# Altium schematic sheet Sheet1.SchDoc
size B; DrawnBy: DMK; DocumentNumber: 3; Revision: A; SheetNumber: 1; SheetTotal: 3
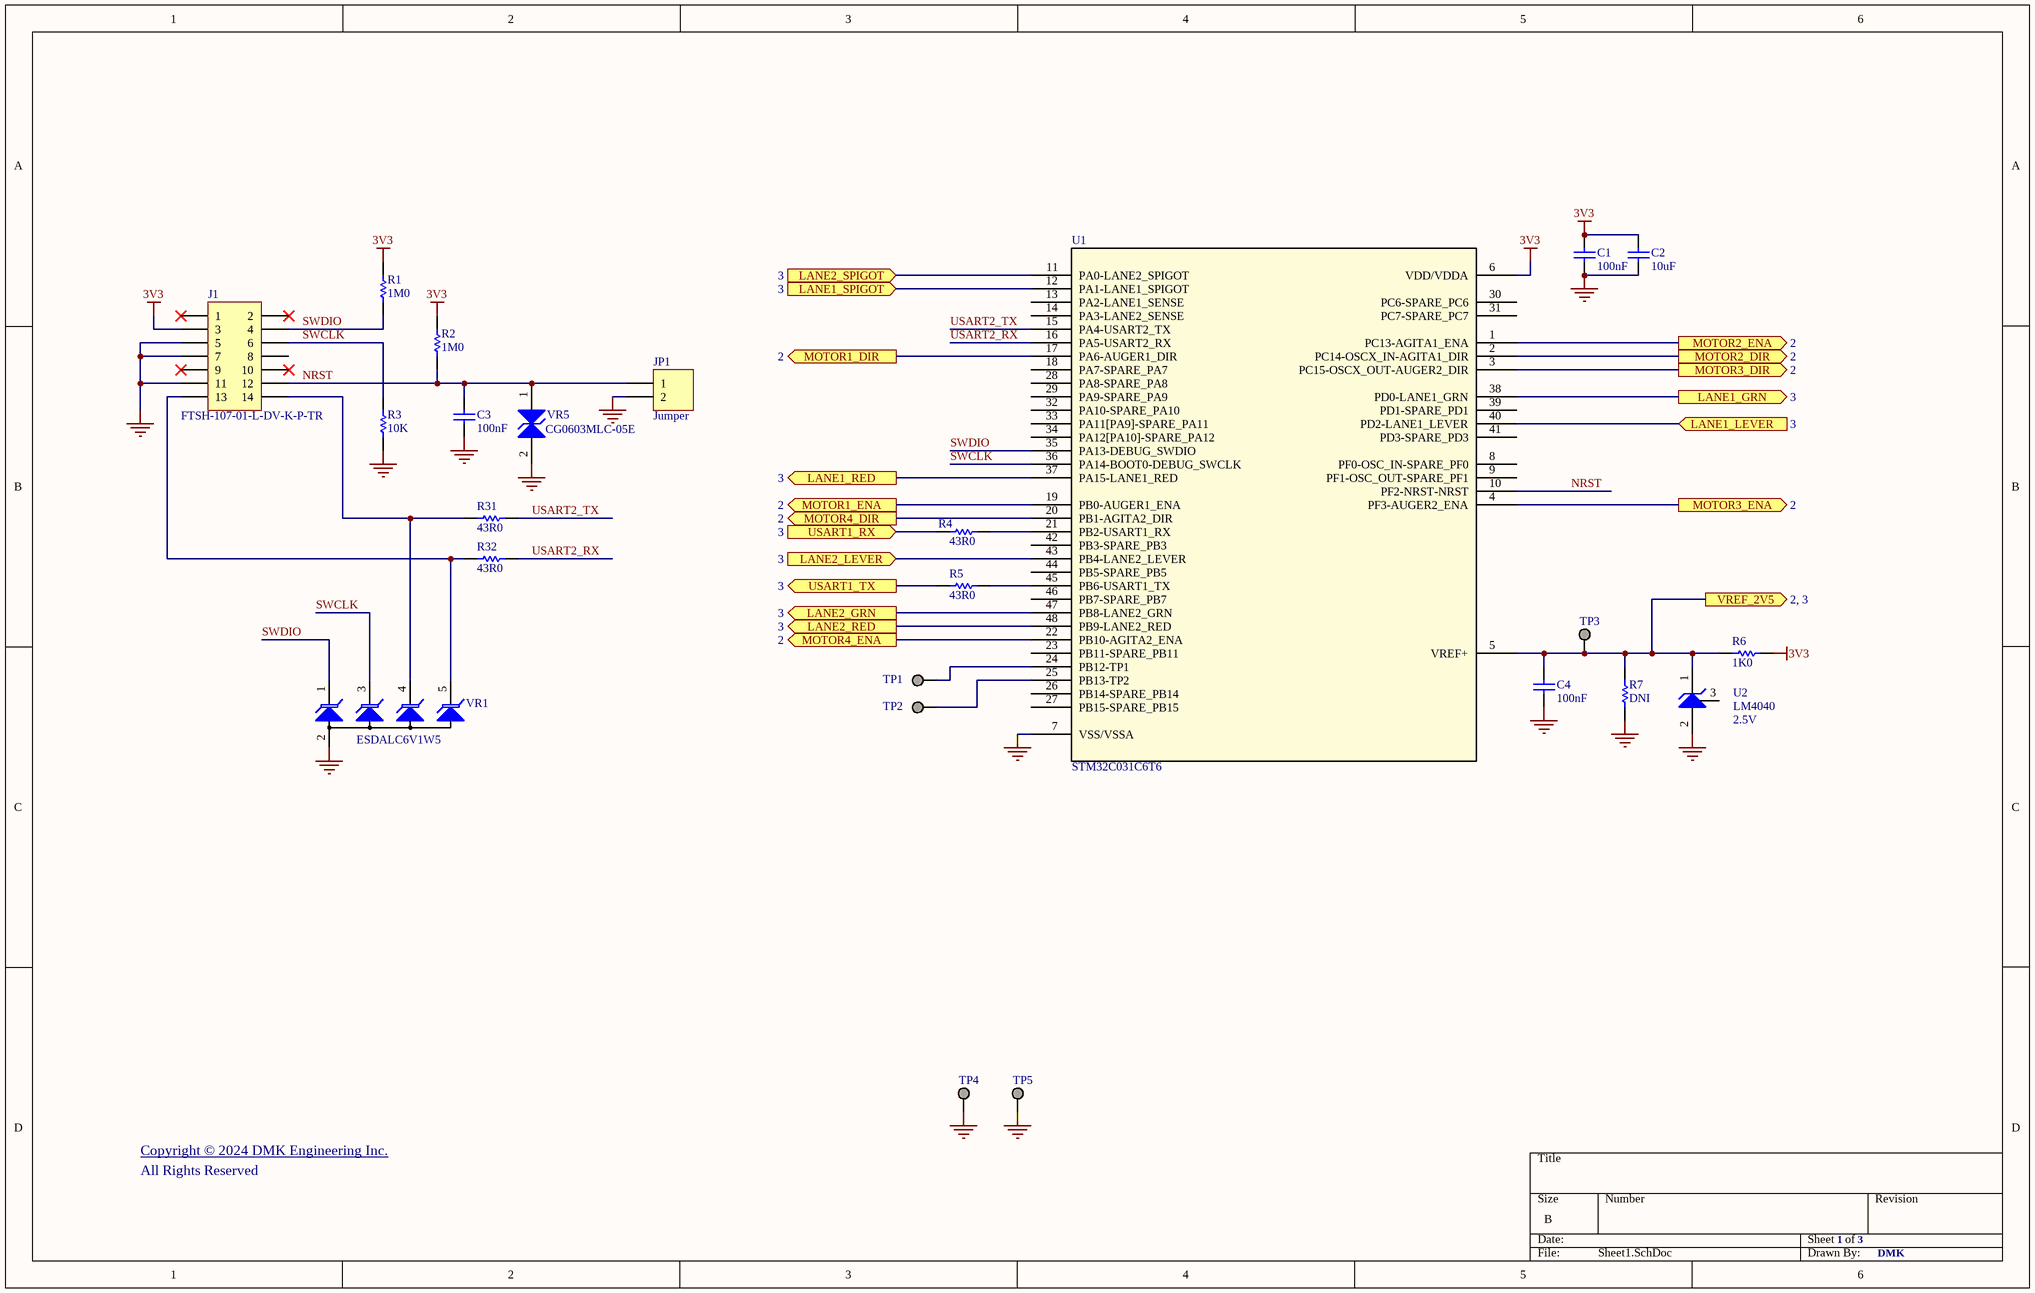
[diagram p0: Sheet1.SchDoc]

## Parts
C1  100nF  [C_0603]
C2  10uF  [C_0805]
C3  100nF  [C_0603]
C4  100nF  [C_0603]
J1  Manufacturer Part Number: FTSH-107-01-L-DV-K-P-TR  [SAMTEC_FTSH-107-01-L-DV-K-P-TR]  (hidden comment: Header 7X2)
JP1  Jumper  [HDR1X2]
R1  1M0  [R_0603]
R2  1M0  [R_0603]
R3  10K  [R_0603]
R4  43R0  [R_0603]
R5  43R0  [R_0603]
R6  1K0  [R_0603]
R7  DNI  [R_0603 - DNI]
R31  43R0  [R_0603]
R32  43R0  [R_0603]
TP1  TEST POINT  [TP]  (value not drawn)  (no BOM)
TP2  TEST POINT  [TP]  (value not drawn)  (no BOM)
TP3  TEST POINT  [TP]  (value not drawn)  (no BOM)
TP4  TEST POINT  [TP]  (value not drawn)  (no BOM)
TP5  TEST POINT  [TP]  (value not drawn)  (no BOM)
U1  STM32C031C6T6  [LQFP48-7x7mm_STM]
U2  LM4040  Output Voltage: 2.5V  [SOT23-3]
VR1  Manufacturer Part Number: ESDALC6V1W5  [SOT-353-5 (SC70)]  (hidden comment: ESD Quad Diode)
VR5  Manufacturer Part Number: CG0603MLC-05E  [BEAD_0603]  (hidden comment: TVS Diode Bidirectional)

## Ports
LANE1_GRN (out, see 3), LANE1_LEVER (in, see 3), LANE1_RED (out, see 3), LANE1_SPIGOT (in, see 3), LANE2_GRN (out, see 3), LANE2_LEVER (in, see 3), LANE2_RED (out, see 3), LANE2_SPIGOT (in, see 3), MOTOR1_DIR (out, see 2), MOTOR1_ENA (out, see 2), MOTOR2_DIR (out, see 2), MOTOR2_ENA (out, see 2), MOTOR3_DIR (out, see 2), MOTOR3_ENA (out, see 2), MOTOR4_DIR (out, see 2), MOTOR4_ENA (out, see 2), USART1_RX (in, see 3), USART1_TX (out, see 3), VREF_2V5 (out, see 2, 3)

## Nets
3V3: C1.2 C2.2 J1.3 R1.1 R2.1 R6.1 U1.6(VDD/VDDA)
GND: C1.1 C2.1 C3.1 C4.1 J1.5 J1.7 J1.11 JP1.2 R3.2 R7.1 TP4.1 TP5.1 U1.7(VSS/VSSA) U2.2(A) VR1.2(A) VR5.2(A)
LANE1_GRN: U1.38(PD0-LANE1_GRN) ; port LANE1_GRN
LANE1_LEVER: U1.40(PD2-LANE1_LEVER) ; port LANE1_LEVER
LANE1_RED: U1.37(PA15-LANE1_RED) ; port LANE1_RED
LANE1_SPIGOT: U1.12(PA1-LANE1_SPIGOT) ; port LANE1_SPIGOT
LANE2_GRN: U1.47(PB8-LANE2_GRN) ; port LANE2_GRN
LANE2_LEVER: U1.43(PB4-LANE2_LEVER) ; port LANE2_LEVER
LANE2_RED: U1.48(PB9-LANE2_RED) ; port LANE2_RED
LANE2_SPIGOT: U1.11(PA0-LANE2_SPIGOT) ; port LANE2_SPIGOT
MOTOR1_DIR: U1.17(PA6-AUGER1_DIR) ; port MOTOR1_DIR
MOTOR1_ENA: U1.19(PB0-AUGER1_ENA) ; port MOTOR1_ENA
MOTOR2_DIR: U1.2(PC14-OSCX_IN-AGITA1_DIR) ; port MOTOR2_DIR
MOTOR2_ENA: U1.1(PC13-AGITA1_ENA) ; port MOTOR2_ENA
MOTOR3_DIR: U1.3(PC15-OSCX_OUT-AUGER2_DIR) ; port MOTOR3_DIR
MOTOR3_ENA: U1.4(PF3-AUGER2_ENA) ; port MOTOR3_ENA
MOTOR4_DIR: U1.20(PB1-AGITA2_DIR) ; port MOTOR4_DIR
MOTOR4_ENA: U1.22(PB10-AGITA2_ENA) ; port MOTOR4_ENA
NRST: C3.2 J1.12 JP1.1 R2.2 U1.10(PF2-NRST-NRST) VR5.1(K)
SWCLK: J1.6 R3.1 U1.36(PA14-BOOT0-DEBUG_SWCLK) VR1.3(K2)
SWDIO: J1.4 R1.2 U1.35(PA13-DEBUG_SWDIO) VR1.1(K1)
USART1_RX: R4.2 ; port USART1_RX
USART1_TX: R5.2 ; port USART1_TX
USART2_RX: R32.1 U1.16(PA5-USART2_RX)
USART2_TX: R31.1 U1.15(PA4-USART2_TX)
VREF_2V5: C4.2 R6.2 R7.2 TP3.1 U1.5(VREF+) U2.1(K) ; port VREF_2V5
NetJ1_13: J1.13 R32.2 VR1.5(K4)
NetJ1_14: J1.14 R31.2 VR1.4(K3)
NetR4_1: R4.1 U1.21(PB2-USART1_RX)
NetR5_1: R5.1 U1.45(PB6-USART1_TX)
NetTP1_1: TP1.1 U1.24(PB12-TP1)
NetTP2_1: TP2.1 U1.25(PB13-TP2)

Not connected (* = marked no-connect by the designer): J1 1* 2* 8 9* 10*; U1 8(PF0-OSC_IN-SPARE_PF0) 9(PF1-OSC_OUT-SPARE_PF1) 13(PA2-LANE1_SENSE) 14(PA3-LANE2_SENSE) 18(PA7-SPARE_PA7) 23(PB11-SPARE_PB11) 26(PB14-SPARE_PB14) 27(PB15-SPARE_PB15) 28(PA8-SPARE_PA8) 29(PA9-SPARE_PA9) 30(PC6-SPARE_PC6) 31(PC7-SPARE_PC7) 32(PA10-SPARE_PA10) 33(PA11[PA9]-SPARE_PA11) 34(PA12[PA10]-SPARE_PA12) 39(PD1-SPARE_PD1) 41(PD3-SPARE_PD3) 42(PB3-SPARE_PB3) 44(PB5-SPARE_PB5) 46(PB7-SPARE_PB7); U2 3(ADJ)

## Notes on the sheet
- Copyright © 2024 DMK Engineering Inc. <www.dmkeng.com>
- All Rights Reserved

## Library data of the parts
C1 C3 C4 = CAP: CAP CER 0.1UF 50V X7R 0603; Manufacturer: Samsung; Manufacturer Part Number: CL10B104KB8NNWC; Tolerance: 10%; Capacitance: 100nF; Supplier 1: Mouser; Supplier Part Number 1: 187-CL10B104KB8NNWC; RoHS: Yes; Category: Ceramic Capacitors; Stock 1: 581862; Pricing 1: 1=0.1, 10=0.009, 50=0.009, 100=0.006, 1000=0.005, 10000=0.003 (USD); Mounting Technology: Surface Mount; Case/Package: 0603; Case Code (Metric): 1608; Case Code (Imperial): 0603; Min Operating Temperature: -55°C; Max Operating Temperature: 125°C; Package Quantity: 1; Packaging: Cut Tape; Value: 100nF; Voltage Rating: 50V; Series: CL; Length: 0.063inch; Width: 0.031inch; Thickness: 0.035inch; RoHS Compliant: Yes; ComponentLink1URL: https://datasheet.ciiva.com/25740/cl10b104kb8nnwc-25740227.pdf?src-supplier=Digikey; ComponentLink1Description: https://datasheet.ciiva.com/25740/cl10b104kb8nnwc-25740227.pdf?src-supplier=Digikey
C2 = CAP: Multilayer Ceramic Capacitor, 10 uF, 25 V, ± 10%, X5R, 0805 [2012 Metric]; Manufacturer: Samsung; Manufacturer Part Number: CL21A106KAYNNNE; Voltage Rating: 25V; Value: 10uF; Supplier 1: Mouser; Supplier Part Number 1: 187-CL21A106KAYNNNE; RoHS: Yes; Category: Ceramic Capacitors; Stock 1: 463149; Pricing 1: 1=0.18, 10=0.073, 50=0.073, 100=0.043, 1000=0.035, 2000=0.029, 10000=0.026, 24000=0.024, 50000=0.022, 100000=0.018 (USD); Mounting Technology: Surface Mount; Case/Package: 0805; Case Code (Metric): 2012; Case Code (Imperial): 0805; Material: Ceramic; Min Operating Temperature: -55°C; Max Operating Temperature: 85°C; Package Quantity: 1; Packaging: Tape and Reel; Tolerance: 10%; Dielectric: X5R; Series: CL; Construction: Flat; Voltage Rating (DC): 25V; Length: 2mm; Width: 0.049inch; Height: 1.25mm; Depth: 1.25mm; Thickness: 0.057inch; Radiation Hardening: No; RoHS Compliant: Yes; ComponentLink1URL: https://datasheet.ciiva.com/25796/cl21a106kaynnne-25796720.pdf?src-supplier=Digikey; ComponentLink1Description: https://datasheet.ciiva.com/25796/cl21a106kaynnne-25796720.pdf?src-supplier=Digikey; ComponentLink2URL: https://datasheet.ciiva.com/26838/getdatasheetpartid-357558-26838583.pdf?src-supplier=Verical; ComponentLink2Description: https://datasheet.ciiva.com/26838/getdatasheetpartid-357558-26838583.pdf?src-supplier=Verical
J1 = Header 7X2: Conn Unshrouded Header HDR 14 POS 1.27mm Solder ST Top Entry SMD T/R; Manufacturer: Samtec; Number of Contacts: 14; Gender: Male; Supplier 1: Mouser; Supplier Part Number 1: 200-FTSH10701LDVKPTR; RoHS: Yes; Category: Headers and Wire Housings; Stock 1: 3070; Pricing 1: 1=4.94, 10=4.46, 50=4.46, 100=3.95, 250=3.5, 400=3.44, 1000=3.44, 2400=3.32, 4800=2.5, 10000=3.32 (USD); Contact Plating: Gold; Number of Rows: 2; Termination: Solder; Pitch: 1.27mm; Lead Free: Lead Free; RoHS Compliant: Yes; ComponentLink1URL: https://datasheet.ciiva.com/10025/ftsh-mt-10025356.pdf?src-supplier=Avnet; ComponentLink1Description: https://datasheet.ciiva.com/10025/ftsh-mt-10025356.pdf?src-supplier=Avnet
JP1 = Header 2: Jumper, 2-Pin (DNI); LatestRevisionDate: 17-Jul-2002; LatestRevisionNote: Re-released for DXP Platform.; Publisher: Altium Limited
R1 R2 = CMP-2002-07535-1: Res Thick Film 0603 1M Ohm 1% 1/10W ±100ppm/°C Molded SMD Punched Carrier T/R; Manufacturer: Panasonic; Manufacturer Part Number: ERJ-3EKF1004V; Value: 1MR; Power Rating: 100mW; Voltage Rating: 75V; Resistance: 1M0; Supplier 1: Mouser; Supplier Part Number 1: 667-ERJ-3EKF1004V; RoHS: Yes; Category: Chip SMD Resistors; Stock 1: 940335; Pricing 1: 1=0.11, 10=0.043, 50=0.043, 100=0.017, 1000=0.008, 5000=0.005, 10000=0.004 (USD); Mounting Technology: Surface Mount; Case/Package: 0603; Pins: 2; Case Code (Imperial): 0603; Case Code (Metric): 1608; Contact Plating: Tin; Min Operating Temperature: -55°C; Max Operating Temperature: 155°C; Tolerance: 1%; Packaging: Tape and Reel; Package Quantity: 1; Termination: SMD/SMT; Resistor Type: Thick Film; Number of Terminations: 2; Temperature Coefficient: 100ppm/°C; Max Power Dissipation: 100mW; Features: Automotive AEC-Q200; Series: ERJ; Resistance Tolerance: 1%; Construction: Rectangular; Voltage Rating (DC): 75V; Length: 1.6mm; Width: 0.8mm; Height: 0.022inch; Depth: 0.8mm; Reach SVHC Compliant: No; Military Standard: Not; RoHS Compliant: Yes; Lead Free: 5697LeadFree; ComponentLink1URL: http://www.farnell.com/datasheets/1911175.pdf?src-supplier=Farnell; ComponentLink1Description: http://www.farnell.com/datasheets/1911175.pdf?src-supplier=Farnell; ComponentLink2URL: http://www.farnell.com/datasheets/1678782.pdf?src-supplier=Farnell; ComponentLink2Description: http://www.farnell.com/datasheets/1678782.pdf?src-supplier=Farnell; ComponentLink3URL: http://components.arrow.com/part/dataview/3985224S9849817N1386?src-supplier=Arrow+Electronics; ComponentLink3Description: http://components.arrow.com/part/dataview/3985224S9849817N1386?src-supplier=Arrow+Electronics; ComponentLink4URL: http://www.farnell.com/datasheets/1911175.pdf?src-supplier=Element14; ComponentLink4Description: http://www.farnell.com/datasheets/1911175.pdf?src-supplier=Element14; ComponentLink5URL: http://www.farnell.com/datasheets/1678782.pdf?src-supplier=Element14; ComponentLink5Description: http://www.farnell.com/datasheets/1678782.pdf?src-supplier=Element14; ComponentLink6URL: https://datasheet.octopart.com/ERJ-3EKF1004V-Panasonic-datasheet-10025800.pdf?src-supplier=Element14; ComponentLink6Description: https://datasheet.octopart.com/ERJ-3EKF1004V-Panasonic-datasheet-10025800.pdf?src-supplier=Element14; ComponentLink7URL: https://datasheet.octopart.com/ERJ-3EKF1004V-Panasonic-datasheet-136608610.pdf?src-supplier=Farnell; ComponentLink7Description: https://datasheet.octopart.com/ERJ-3EKF1004V-Panasonic-datasheet-136608610.pdf?src-supplier=Farnell; ComponentLink8URL: https://datasheet.octopart.com/ERJ-3EKF1004V-Panasonic-datasheet-82288794.pdf?src-supplier=Future+Electronics; ComponentLink8Description: https://datasheet.octopart.com/ERJ-3EKF1004V-Panasonic-datasheet-82288794.pdf?src-supplier=Future+Electronics; ComponentLink9URL: http://industrial.panasonic.com/www-data/pdf/AOA0000/AOA0000CE2.pdf?src-supplier=Avnet; ComponentLink9Description: http://industrial.panasonic.com/www-data/pdf/AOA0000/AOA0000CE2.pdf?src-supplier=Avnet; ComponentLink10URL: https://datasheet.octopart.com/ERJ-3EKF1004V-Panasonic-datasheet-154766169.pdf?src-supplier=Master+Electronics; ComponentLink10Description: https://datasheet.octopart.com/ERJ-3EKF1004V-Panasonic-datasheet-154766169.pdf?src-supplier=Master+Electronics
R3 = CMP-2002-07535-1: SMD Chip Resistor, 10 kohm, ± 1%, 100 mW, 0603 [1608 Metric], Thick Film, Precision; Manufacturer: Panasonic; Manufacturer Part Number: ERJ-3EKF1002V; Value: 10kR; Power Rating: 100mW; Voltage Rating: 75V; Temperature Coefficient: 100ppm/°C; Resistance: 10K; Supplier 1: Mouser; Supplier Part Number 1: 667-ERJ-3EKF1002V; RoHS: Yes; Category: Chip SMD Resistors; Stock 1: 4766252; Pricing 1: 1=0.1, 10=0.02, 50=0.02, 100=0.012, 1000=0.009, 5000=0.006, 10000=0.006, 100000=0.005 (USD); Mounting Technology: Surface Mount; Case/Package: 0603; Pins: 2; Case Code (Metric): 1608; Case Code (Imperial): 0603; Contact Plating: Tin; Min Operating Temperature: -55°C; Max Operating Temperature: 155°C; Tolerance: 1%; Packaging: Tape and Reel; Package Quantity: 1; Resistor Type: Thick Film; Number of Terminations: 2; Termination: SMD/SMT; Max Power Dissipation: 100mW; Features: Automotive AEC-Q200; Series: ERJ; Technology: THICK FILM; Resistance Tolerance: 1%; Construction: Rectangular; Voltage Rating (DC): 75V; Length: 1.6mm; Width: 0.8mm; Height: 0.45mm; Depth: 0.8mm; Radiation Hardening: No; Reach SVHC Compliant: No; Military Standard: Not; RoHS Compliant: Yes; Lead Free: 5697LeadFree; ComponentLink1URL: https://datasheet.ciiva.com/16759/70260748-16759807.pdf?src-supplier=Allied+Electronics; ComponentLink1Description: https://datasheet.ciiva.com/16759/70260748-16759807.pdf?src-supplier=Allied+Electronics
R4 R5 R31 R32 = CMP-2002-07535-1: CRCW Thick Film Commodity Chip Resistor 0603 Size 43 Ohm 1% 0.1 W 100 ppm/K 2-Pin SMD Paper T/R; Manufacturer: Vishay; Manufacturer Part Number: CRCW060343R0FKEAC; Value: 43R; Resistance: 43R0; Supplier 1: Mouser; Supplier Part Number 1: 71-CRCW060343R0FKEAC; RoHS: Yes; Category: Chip SMD Resistors; Stock 1: 77921; Pricing 1: 1=0.1, 10=0.018, 50=0.018, 100=0.008, 1000=0.006, 10000=0.003 (USD); Case/Package: 345Case; Lead Free: 5697LeadFree
R6 = CMP-2002-07535-1: CRCW Thick Film Commodity Chip Resistor 0603 Size 1K Ohm 1% 0.1 W 100 ppm/K 2-Pin SMD Paper T/R; Manufacturer: Vishay Dale; Manufacturer Part Number: CRCW06031K00FKECC; Value: 1kR; Resistance: 1K0; Supplier 1: Mouser; Supplier Part Number 1: 71-CRCW06031K00FKECC; RoHS: Yes; Category: Chip SMD Resistors; Stock 1: 54714; Pricing 1: 1=0.1, 10=0.018, 50=0.018, 100=0.008, 1000=0.006, 10000=0.004 (USD); Case/Package: 345Case; RoHS Compliant: Yes; Lead Free: 5697LeadFree
R7 = CMP-2002-07535-1: Resistance: DNI
TP1-TP5 = TEST POINT: Part of PCB
U1 = STM32C031C6T6: RISC Microcontroller, 32-Bit, FLASH, CORTEX-M4F CPU, 180MHz, CMOS, PBGA216; Mfr_Name: STMicroelectronics; RefDes: RefDes; Type: Type; Supplier 1: Mouser; Supplier Part Number 1: 511-STM32C031C6T6; Manufacturer: STMicroelectronics; Manufacturer Part Number: STM32C031C6T6; RoHS: No; Category: Uncategorized; Stock 1: 1018; Pricing 1: 1=1.93, 10=1.4, 50=1.4, 100=1.39, 1000=0.946, 10000=0.848 (USD)
U2 = LM4040-SOT23: Fixed voltage, 45-µA, precision micropower shunt voltage reference 3-SOT-23 -40 to 85; Manufacturer: Texas Instruments; Manufacturer Part Number: LM4040C25IDBZR; Tolerance: 0.5%; Max Output current: 15mA; Temperature Coefficient: 100ppm/°C; Cathode Current: 75uA; Number of Channels: 1; Supplier 1: Mouser; Supplier Part Number 1: 595-LM4040C25IDBZR; RoHS: Yes; Category: Voltage References; Stock 1: 26053; Pricing 1: 1=0.83, 10=0.73, 50=0.73, 100=0.587, 1000=0.443, 10000=0.363 (USD); Case/Package: SOT-23; Pins: 3; Min Operating Temperature: -40°C; Max Operating Temperature: 125°C; Packaging: Tape and Reel; Package Quantity: 1; Output Current: 15mA; Max Output Voltage: 2.5V; Reference Type: Shunt; Series: -; Reference Voltage: 2.5V; Radiation Hardening: No; Lead Free: Lead Free; RoHS Compliant: Yes; Reach SVHC Compliant: No; ComponentLink1URL: https://datasheet.ciiva.com/2006/lm4040d82-2006368.pdf?src-supplier=Digikey; ComponentLink1Description: https://datasheet.ciiva.com/2006/lm4040d82-2006368.pdf?src-supplier=Digikey; ComponentLink2URL: https://datasheet.ciiva.com/41677/1848915-41677303.pdf?src-supplier=Newark; ComponentLink2Description: https://datasheet.ciiva.com/41677/1848915-41677303.pdf?src-supplier=Newark; ComponentLink3URL: https://datasheet.ciiva.com/46391/1887470-46391479.pdf?src-supplier=Element14; ComponentLink3Description: https://datasheet.ciiva.com/46391/1887470-46391479.pdf?src-supplier=Element14; ComponentLink4URL: https://datasheet.ciiva.com/46424/1848915-46424687.pdf?src-supplier=Element14; ComponentLink4Description: https://datasheet.ciiva.com/46424/1848915-46424687.pdf?src-supplier=Element14; ComponentLink5URL: https://datasheet.ciiva.com/2006/lm4040d82-2006367.pdf?src-supplier=Digikey; ComponentLink5Description: https://datasheet.ciiva.com/2006/lm4040d82-2006367.pdf?src-supplier=Digikey; ComponentLink6URL: https://datasheet.ciiva.com/2006/lm4040d82-2006366.pdf?src-supplier=Digikey; ComponentLink6Description: https://datasheet.ciiva.com/2006/lm4040d82-2006366.pdf?src-supplier=Digikey; ComponentLink7URL: https://datasheet.ciiva.com/15148/getdatasheetpartid-111141-15148621.pdf?src-supplier=Verical; ComponentLink7Description: https://datasheet.ciiva.com/15148/getdatasheetpartid-111141-15148621.pdf?src-supplier=Verical; ComponentLink8URL: https://datasheet.ciiva.com/3235/lm4040d82-3235387.pdf?src-supplier=Avnet; ComponentLink8Description: https://datasheet.ciiva.com/3235/lm4040d82-3235387.pdf?src-supplier=Avnet
VR1 = ESD Quad Diode: ESDALC Series 4 Channel 6.1V Uni-Directional Transil ESD Protection SOT-323-5L; Manufacturer: STMicroelectronics; Operating Supply Voltage: 3V; Direction: Unidirectional; Number of Elements: 4; Value: 7.5pF; Breakdown Voltage: 7.2V; Peak Pulse Power: 25W; Power Line Protection: No; Leakage Current: 1uA; Test Current: 1mA; ESD Protection: Yes; Peak Pulse Current: 15A; Diode Type: ZENER; Supplier 1: Mouser; Supplier Part Number 1: 511-ESDALC6V1W5; RoHS: Yes; Category: TVS Diodes; Stock 1: 2738; Pricing 1: 1=0.36, 10=0.282, 50=0.282, 100=0.17, 1000=0.146, 10000=0.084 (USD); Mounting Technology: Surface Mount; Case/Package: SOT-323; Pins: 5; Weight: 0.00019oz; Min Operating Temperature: -40°C; Max Operating Temperature: 150°C; Packaging: Tape and Reel; Package Quantity: 3000; Reverse Breakdown Voltage: 6.1V; Polarity: Unidirectional; Number of Channels: 4; Termination: SMD/SMT; Number of Unidirectional Channels: 4; Reverse Standoff Voltage: 3V; Min Breakdown Voltage: 6.1V; Working Voltage: 3V; Max Power Dissipation: 25W; Max Breakdown Voltage: 7.2V; Max Reverse Leakage Current: 1uA; Voltage Rating (DC): 6.1V; Series: ESDA, TRANSIL™; Length: 2.2mm; Width: 1.35mm; Height: 1mm; Depth: 1.35mm; Radiation Hardening: No; Reach SVHC Compliant: No; Lead Free: Lead Free; RoHS Compliant: Yes
VR5 = TVS Diode Bidirectional: ESD Suppressor Multilayer Varistor 5V Automotive 2-Pin Case 0603(1608Metric) T/R; Manufacturer: Bourns; Current Rating: 50nA; Value: 0.5pF; Voltage Rating (AC): 8V; Number of Channels: 1; Clamping Voltage: 20V; Supplier 1: Mouser; Supplier Part Number 1: 652-CG0603MLC-05E; RoHS: Yes; Category: Varistors; Stock 1: 20474; Pricing 1: 1=0.36, 10=0.232, 50=0.232, 100=0.139, 1000=0.1, 5000=0.094, 10000=0.086, 25000=0.08, 50000=0.072, 100000=0.069 (USD); Case/Package: 0603; Pins: 2; Case Code (Imperial): 0603; Case Code (Metric): 1608; Contact Plating: Tin; Min Operating Temperature: -40°C; Max Operating Temperature: 85°C; Package Quantity: 1; Packaging: Tape and Reel; Termination: SMD/SMT; Series: MLC; Voltage Rating (DC): 5V; Operating Supply Voltage: 5V; Voltage: 5V; Number of Circuits: 1; Max Voltage Rating (DC): 5V; Working Voltage: 5V; Leakage Current: 50nA; Length: 1.6mm; Width: 0.8mm; Depth: 0.8mm; Thickness: 0.8mm; Radiation Hardening: No; Reach SVHC Compliant: No; RoHS Compliant: Yes; ComponentLink1URL: https://datasheet.ciiva.com/1278/1785244-1278701.pdf?src-supplier=Element14; ComponentLink1Description: https://datasheet.ciiva.com/1278/1785244-1278701.pdf?src-supplier=Element14; ComponentLink2URL: https://datasheet.ciiva.com/22696/1785244-22696318.pdf?src-supplier=Element14; ComponentLink2Description: https://datasheet.ciiva.com/22696/1785244-22696318.pdf?src-supplier=Element14; ComponentLink3URL: https://datasheet.ciiva.com/8084/mlc-8084047.pdf?src-supplier=Avnet; ComponentLink3Description: https://datasheet.ciiva.com/8084/mlc-8084047.pdf?src-supplier=Avnet; ComponentLink4URL: https://datasheet.ciiva.com/6991/mlc-6991836.pdf?src-supplier=Digikey; ComponentLink4Description: https://datasheet.ciiva.com/6991/mlc-6991836.pdf?src-supplier=Digikey; ComponentLink5URL: https://datasheet.ciiva.com/6991/mlc-6991832.pdf?src-supplier=Digikey; ComponentLink5Description: https://datasheet.ciiva.com/6991/mlc-6991832.pdf?src-supplier=Digikey